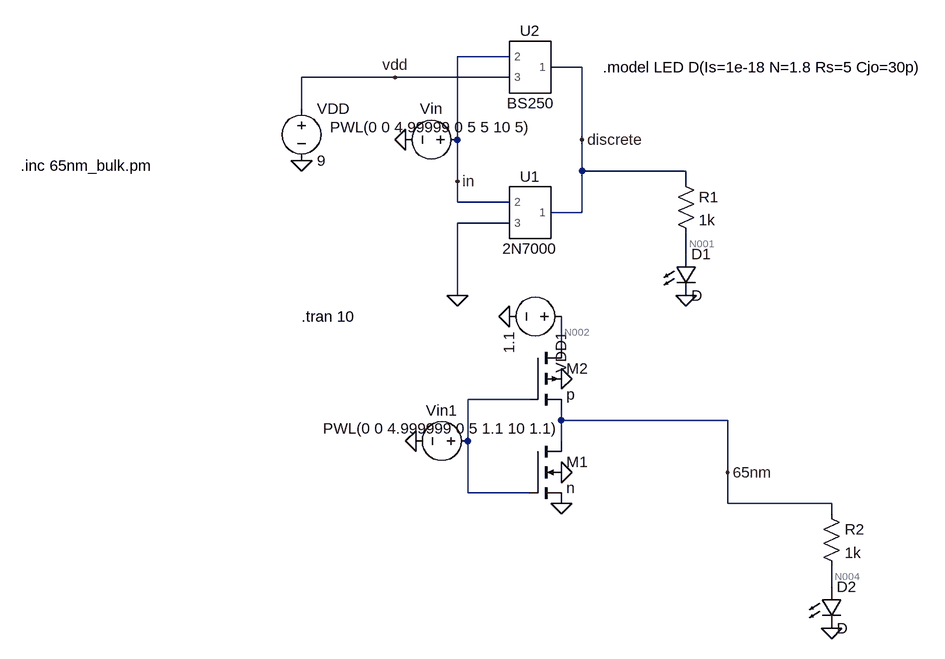
[diagram p0: schematic circuit_l5.asc]
circuit_l5.asc, the LTspice schematic file:
Version 4.1
SHEET 1 1216 916
WIRE -240 16 -320 16
WIRE -128 32 -176 32
WIRE -416 48 -560 48
WIRE -240 48 -416 48
WIRE -560 96 -560 48
WIRE -320 144 -320 16
WIRE -128 144 -128 32
WIRE -128 192 -128 144
WIRE 32 192 -128 192
WIRE -320 208 -320 144
WIRE 32 208 32 192
WIRE -320 240 -320 208
WIRE -240 240 -320 240
WIRE -128 256 -128 192
WIRE -128 256 -176 256
WIRE -240 272 -320 272
WIRE 32 320 32 288
WIRE -320 384 -320 272
WIRE -160 464 -160 416
WIRE -208 544 -304 544
WIRE -160 576 -160 560
WIRE 96 576 -160 576
WIRE -304 608 -304 544
WIRE -160 608 -160 576
WIRE 96 656 96 576
WIRE -304 688 -304 608
WIRE -208 688 -304 688
WIRE 96 704 96 656
WIRE 256 704 96 704
WIRE 256 720 256 704
WIRE 256 832 256 800
FLAG -320 384 0
FLAG -400 144 0
FLAG -560 176 0
FLAG -128 144 discrete
FLAG 32 384 0
FLAG -320 208 in
FLAG 96 656 65nm
FLAG 256 896 0
FLAG -416 48 vdd
FLAG -160 512 0
FLAG -160 704 0
FLAG -160 656 0
FLAG -384 608 0
FLAG -240 416 0
SYMBOL 2N7000 -208 256 M0
SYMATTR InstName U1
SYMBOL BS250 -208 32 M0
SYMATTR InstName U2
SYMBOL voltage -304 144 R90
WINDOW 0 -32 56 VBottom 2
WINDOW 3 -4 56 VBottom 2
WINDOW 123 0 0 Left 0
WINDOW 39 0 0 Left 0
SYMATTR InstName Vin
SYMATTR Value PWL(0 0 4.99999 0 5 5 10 5)
SYMBOL voltage -560 80 R0
WINDOW 123 0 0 Left 0
WINDOW 39 0 0 Left 0
SYMATTR InstName VDD
SYMATTR Value 9
SYMBOL res 16 192 R0
SYMATTR InstName R1
SYMATTR Value 1k
SYMBOL LED 16 320 R0
SYMATTR InstName D1
SYMBOL res 240 704 R0
SYMATTR InstName R2
SYMATTR Value 1k
SYMBOL LED 240 832 R0
SYMATTR InstName D2
SYMBOL nmos4 -208 608 R0
SYMATTR InstName M1
SYMATTR Value n
SYMATTR Value2 l=65nm
SYMBOL pmos4 -208 464 R0
SYMATTR InstName M2
SYMATTR Value p
SYMATTR Value2 l=65nm
SYMBOL voltage -288 608 R90
WINDOW 0 -32 56 VBottom 2
WINDOW 3 -4 56 VBottom 2
WINDOW 123 0 0 Left 0
WINDOW 39 0 0 Left 0
SYMATTR InstName Vin1
SYMATTR Value PWL(0 0 4.999999 0 5 1.1 10 1.1)
SYMBOL voltage -144 416 R90
WINDOW 123 0 0 Left 0
WINDOW 39 0 0 Left 0
SYMATTR InstName VDD1
SYMATTR Value 1.1
TEXT -96 32 Left 2 !.model LED D(Is=1e-18 N=1.8 Rs=5 Cjo=30p)
TEXT -992 184 Left 2 !.inc 65nm_bulk.pm
TEXT -560 416 Left 2 !.tran 10

The netlist it stands for:
* circuit_l5.asc
X§U1 discrete in 0 2N7000  ; pins 1 2 3
X§U2 discrete in vdd BS250  ; pins 1 2 3
Vin in 0 PWL(0 0 4.99999 0 5 5 10 5)
VDD vdd 0 9
R1 discrete N001 1k
D1 N001 0 D
R2 65nm N004 1k
D2 N004 0 D
M1 65nm N003 0 0 n l=65nm
M2 N002 N003 65nm 0 p l=65nm
Vin1 N003 0 PWL(0 0 4.999999 0 5 1.1 10 1.1)
VDD1 N002 0 1.1
.model D D
.lib standard.dio
.model NMOS NMOS
.model PMOS PMOS
.lib standard.mos
.model LED D(Is=1e-18 N=1.8 Rs=5 Cjo=30p)
.inc 65nm_bulk.pm
.tran 10
.lib 2N7000.onsemi.lib
.lib BS250.philips.lib
.backanno
.end

* Results of the author's LTspice run, read from the files saved beside the schematic
* Operating Point, zero values left out:
*   V(65nm) = 795.2 mV
*   V(discrete) = 8.935 V
*   V(n001) = 709.6 mV
*   V(n002) = 1.1 V
*   V(n004) = 611.3 mV
*   V(vdd) = 9 V
*   I(D1) = 8.226 mA
*   I(D2) = 183.9 µA
*   I(R1) = 8.226 mA
*   I(R2) = 183.9 µA
*   I(VDD) = -8.226 mA
*   I(VDD1) = -39.13 mA
*   I(Vin) = 8.935 pA
*   I(Vin1) = 3.468 nA
*   Ib(M2) = -38.94 mA
*   Id(M1) = 127.5 nA
*   Id(M2) = 39.13 mA
*   Ig(M1) = -3.288 nA
*   Ig(M2) = -179.9 pA
*   Is(M1) = -124.2 nA
*   Is(M2) = -184 µA
*   Ix(u1:1) = 334.9 pA
*   Ix(u1:2) = -8.935 pA
*   Ix(u1:3) = -335 pA
*   Ix(u2:1) = -8.226 mA
*   Ix(u2:3) = 8.226 mA
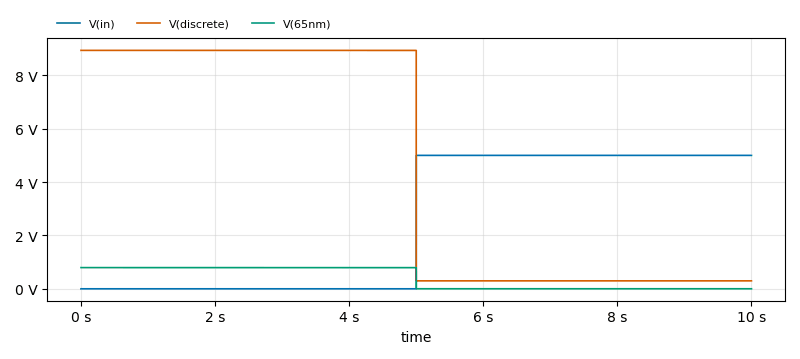
[diagram p1: Transient Analysis of circuit_l5.asc, plotted from the saved traces]
* Transient Analysis, 1 run:
*   V(in): min 0 V, max 5 V, average 2.5 V, rms 3.536 V, last 5 V
*   V(discrete): min 297.7 mV, max 8.935 V, average 4.617 V, rms 6.322 V, last 297.8 mV
*   V(65nm): min 1.353 mV, max 795.2 mV, average 398.3 mV, rms 562.3 mV, last 1.353 mV